# Altium schematic sheet Top_Sheet.SchDoc: =Projectname
size A4; SheetNumber: 1; SheetTotal: 7
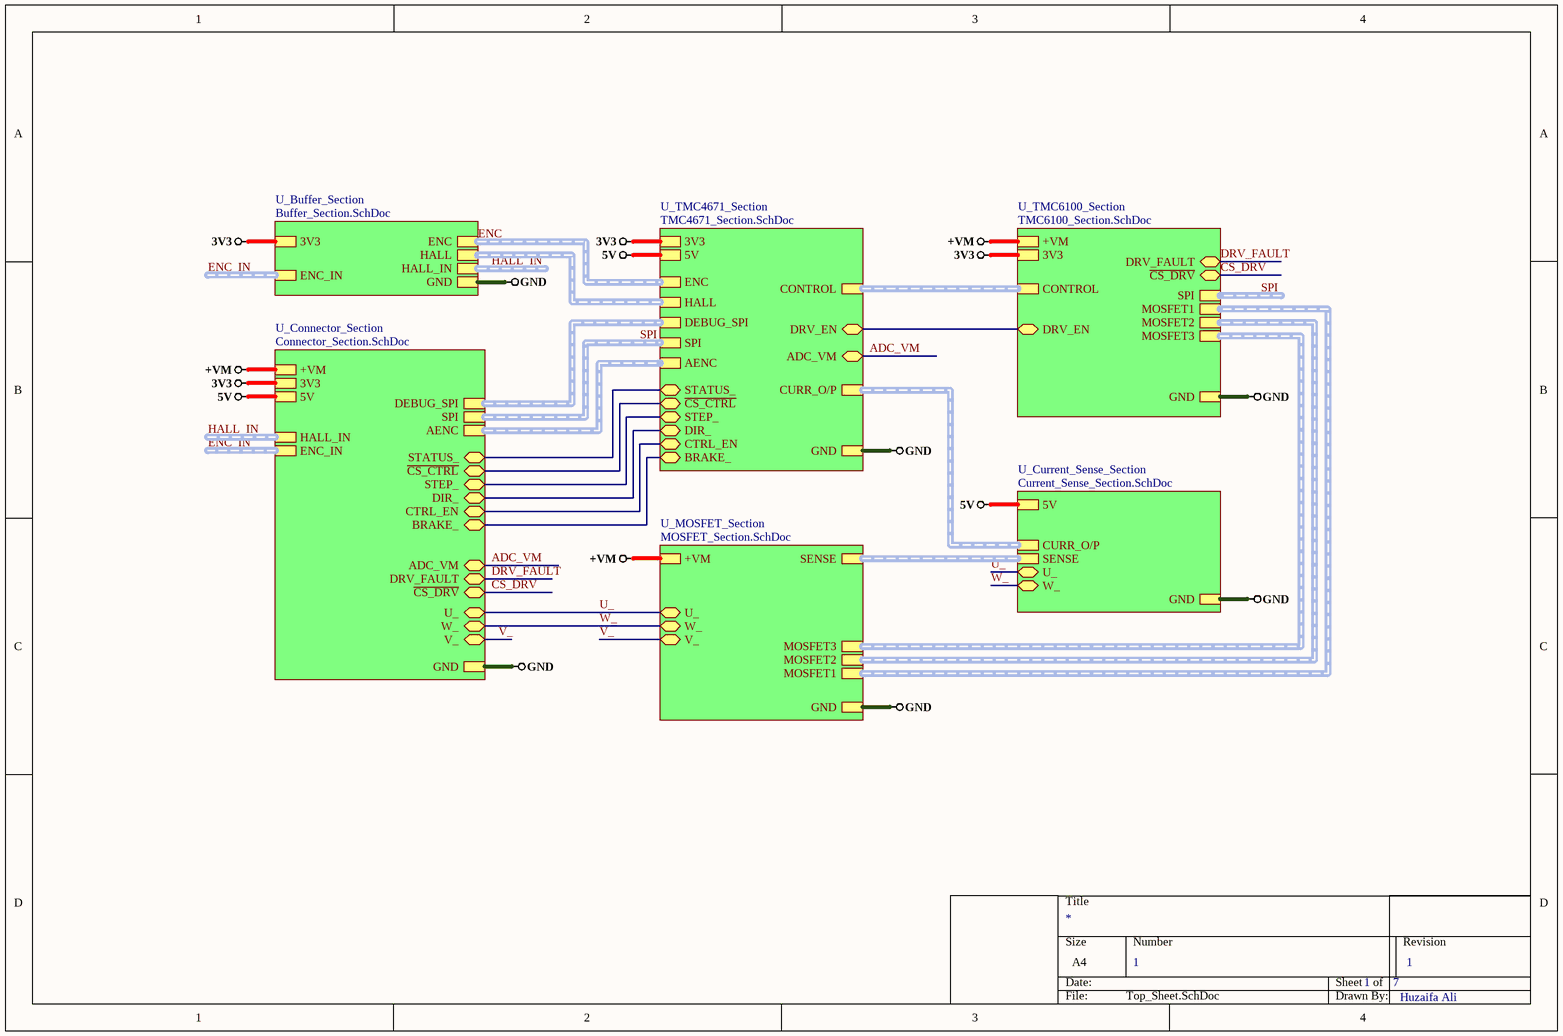
[diagram p0: Top_Sheet.SchDoc]

## Sub-sheets
U_Buffer_Section = Buffer_Section.SchDoc: ENC (harness ENC), HALL (harness HALL), 3V3, GND, HALL_IN (harness HALL_IN), ENC_IN (harness ENC_IN)
U_Connector_Section = Connector_Section.SchDoc: BRAKE_ (bidir), STEP_ (bidir), DIR_ (bidir), CTRL_EN (bidir), U_ (bidir), W_ (bidir), DEBUG_SPI (harness DEBUG_SPI), SPI (harness SPI), ~{CS_CTRL} (bidir), ~{CS_DRV} (bidir), STATUS_ (bidir), DRV_FAULT (bidir), AENC (harness AENC), +VM, 3V3, GND, 5V, HALL_IN (harness HALL_IN), ENC_IN (harness ENC_IN), V_ (bidir), ADC_VM (bidir)
U_Current_Sense_Section = Current_Sense_Section.SchDoc: CURR_O/P (harness CURR_O/P), 5V, GND, SENSE (harness SENSE), U_ (bidir), W_ (bidir)
U_MOSFET_Section = MOSFET_Section.SchDoc: MOSFET1 (harness MOSFET1), MOSFET2 (harness MOSFET2), MOSFET3 (harness MOSFET3), SENSE (harness SENSE), U_ (bidir), W_ (bidir), V_ (bidir), +VM, GND
U_TMC4671_Section = TMC4671_Section.SchDoc: STATUS_ (bidir), BRAKE_ (bidir), ~{CS_CTRL} (bidir), STEP_ (bidir), DIR_ (bidir), CTRL_EN (bidir), DEBUG_SPI (harness DEBUG_SPI), SPI (harness SPI), ENC (harness ENC), HALL (harness HALL), 5V, 3V3, GND, CURR_O/P (harness CURR_O/P), AENC (harness AENC), CONTROL (harness CONTROL), DRV_EN (bidir), ADC_VM (bidir)
U_TMC6100_Section = TMC6100_Section.SchDoc: SPI (harness SPI), CONTROL (harness CONTROL), DRV_FAULT (bidir), ~{CS_DRV} (bidir), MOSFET1 (harness MOSFET1), MOSFET2 (harness MOSFET2), MOSFET3 (harness MOSFET3), DRV_EN (bidir), +VM, 3V3, GND

## Nets
3V3: sheet U_Buffer_Section/3V3, sheet U_Connector_Section/3V3, sheet U_TMC4671_Section/3V3, sheet U_TMC6100_Section/3V3
5V: sheet U_Connector_Section/5V, sheet U_Current_Sense_Section/5V, sheet U_TMC4671_Section/5V
+VM: sheet U_Connector_Section/+VM, sheet U_MOSFET_Section/+VM, sheet U_TMC6100_Section/+VM
GND: sheet U_Buffer_Section/GND, sheet U_Connector_Section/GND, sheet U_Current_Sense_Section/GND, sheet U_MOSFET_Section/GND, sheet U_TMC4671_Section/GND, sheet U_TMC6100_Section/GND
~{CS_DRV}: sheet U_Connector_Section/~{CS_DRV}, sheet U_TMC6100_Section/~{CS_DRV}
ADC_VM: sheet U_Connector_Section/ADC_VM, sheet U_TMC4671_Section/ADC_VM
DRV_FAULT: sheet U_Connector_Section/DRV_FAULT, sheet U_TMC6100_Section/DRV_FAULT
U_: sheet U_Connector_Section/U_, sheet U_Current_Sense_Section/U_, sheet U_MOSFET_Section/U_
V_: sheet U_Connector_Section/V_, sheet U_MOSFET_Section/V_
W_: sheet U_Connector_Section/W_, sheet U_Current_Sense_Section/W_, sheet U_MOSFET_Section/W_
(unnamed): sheet U_Connector_Section/BRAKE_, sheet U_TMC4671_Section/BRAKE_
(unnamed): sheet U_Connector_Section/STEP_, sheet U_TMC4671_Section/STEP_
(unnamed): sheet U_Connector_Section/DIR_, sheet U_TMC4671_Section/DIR_
(unnamed): sheet U_Connector_Section/CTRL_EN, sheet U_TMC4671_Section/CTRL_EN
(unnamed): sheet U_Connector_Section/~{CS_CTRL}, sheet U_TMC4671_Section/~{CS_CTRL}
(unnamed): sheet U_Connector_Section/STATUS_, sheet U_TMC4671_Section/STATUS_
(unnamed): sheet U_TMC4671_Section/DRV_EN, sheet U_TMC6100_Section/DRV_EN

## Buses and harness runs
harness ENC = sheet U_Buffer_Section/ENC = sheet U_TMC4671_Section/ENC
harness ENC_IN = sheet U_Buffer_Section/ENC_IN
harness ENC_IN = sheet U_Connector_Section/ENC_IN
harness HALL_IN = sheet U_Buffer_Section/HALL_IN
harness HALL_IN = sheet U_Connector_Section/HALL_IN
harness sheet U_Buffer_Section/HALL = sheet U_TMC4671_Section/HALL
harness sheet U_Connector_Section/AENC = sheet U_TMC4671_Section/AENC
harness sheet U_Connector_Section/DEBUG_SPI = sheet U_TMC4671_Section/DEBUG_SPI
harness sheet U_Current_Sense_Section/CURR_O/P = sheet U_TMC4671_Section/CURR_O/P
harness sheet U_Current_Sense_Section/SENSE = sheet U_MOSFET_Section/SENSE
harness sheet U_MOSFET_Section/MOSFET1 = sheet U_TMC6100_Section/MOSFET1
harness sheet U_MOSFET_Section/MOSFET2 = sheet U_TMC6100_Section/MOSFET2
harness sheet U_MOSFET_Section/MOSFET3 = sheet U_TMC6100_Section/MOSFET3
harness sheet U_TMC4671_Section/CONTROL = sheet U_TMC6100_Section/CONTROL
harness SPI = sheet U_Connector_Section/SPI = sheet U_TMC4671_Section/SPI
harness SPI = sheet U_TMC6100_Section/SPI

## Notes on the sheet
- 1
- Huzaifa Ali